# Altium schematic sheet Sensor_FMU.SchDoc
size A4; SheetNumber: 3; SheetTotal: 5
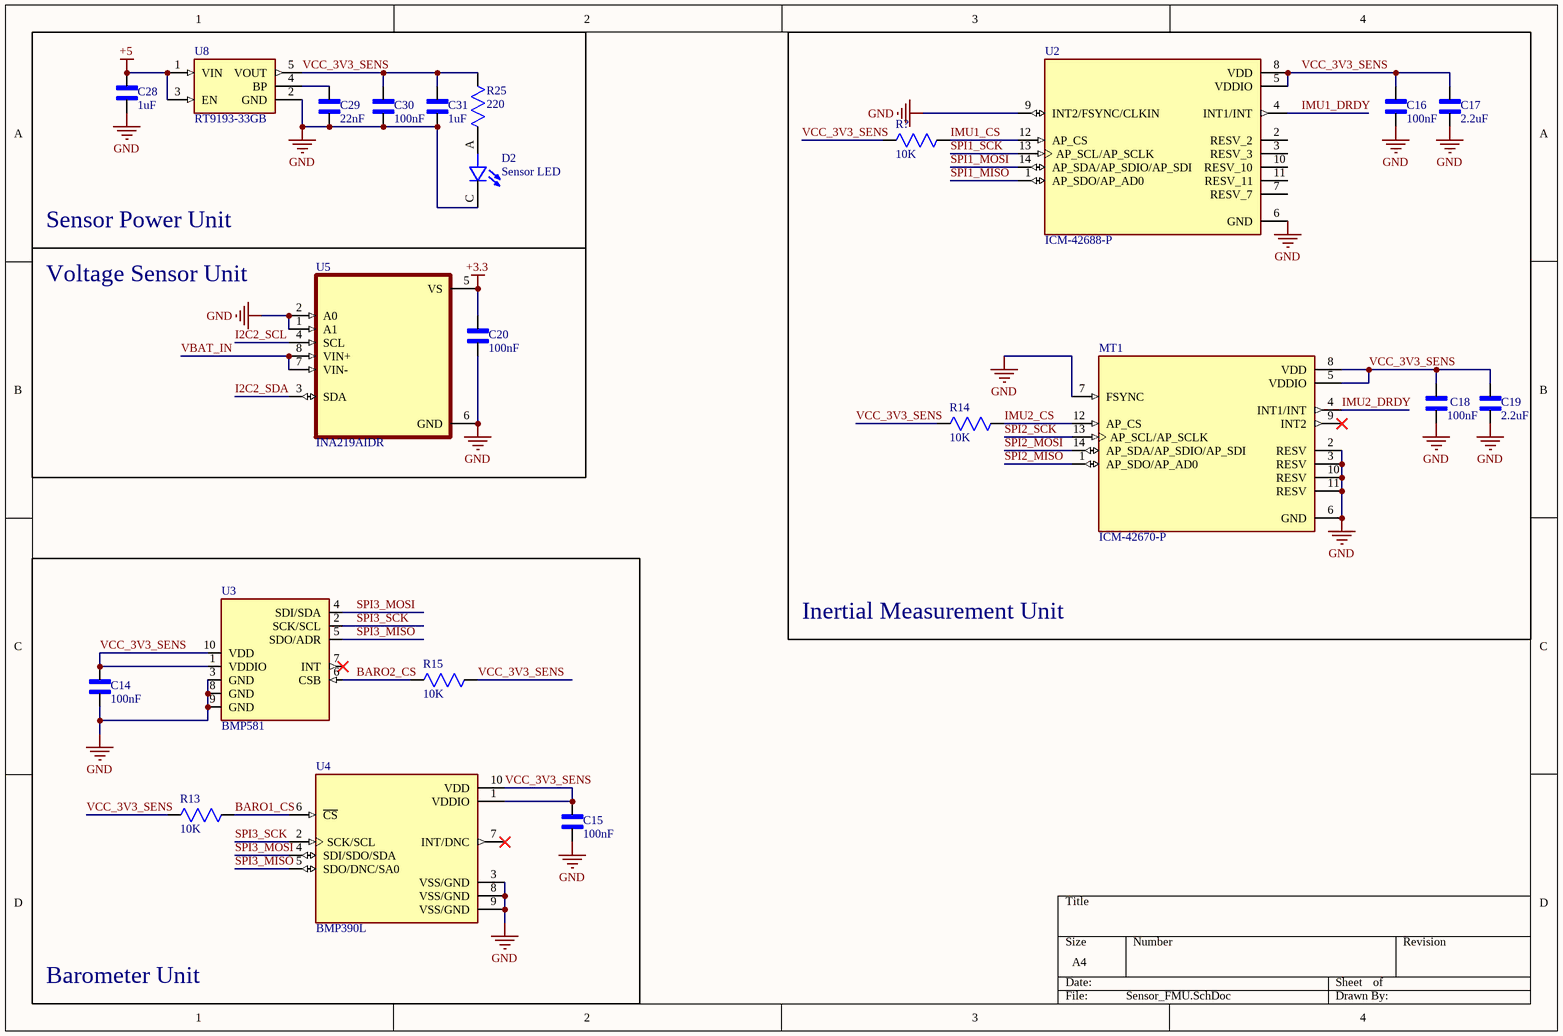
[diagram p0: Sensor_FMU.SchDoc]

## Parts
C14  100nF  [CAPC2012X135N]
C15  100nF  [CAPC2012X135N]
C16  100nF  [CAPC2012X135N]
C17  2.2uF  [CAPC2012X152N]
C18  100nF  [CAPC2012X135N]
C19  2.2uF  [CAPC2012X152N]
C20  100nF  [CAPC1608X90N]
C28  1uF  [CAPC1608X90N]
C29  22nF  [CAPC1608X90N]
C30  100nF  [CAPC1608X90N]
C31  1uF  [CAPC1608X90N]
D2  Sensor LED  [LEDSC125X200X90-2N]
MT1  ICM-42670-P  [XDCR_ICM-42670-P]
R13  10K  [RESC2013X65N]
R14  10K  [RESC2013X65N]
R15  10K  [RESC2013X65N]
R25  220  [RESC2013X65N]
R?  10K  [RESC2013X65N]
U2  ICM-42688-P  [PQFN50P300X250X97-14N]
U3  BMP581  [BMP581]
U4  BMP390L  [XDCR_BMP390L]
U5  INA219AIDR  [SOIC127P599X175-8N]
U8  RT9193-33GB  [SOT94P279X129-5N]

## Blocks framed on the sheet
Sensor Power Unit: C28-C31 D2 R25 U8
Inertial Measurement Unit: C16-C19 MT1 R14 R? U2
Voltage Sensor Unit: C20 U5
Barometer Unit: C14 C15 R13 R15 U3 U4

## Nets
+3.3: C20.2 U5.5(VS)
+5: C28.2 U8.1(VIN) U8.3(EN)
GND: C14.1 C15.1 C16.1 C17.2 C18.1 C19.2 C20.1 C28.1 C29.1 C30.1 C31.1 D2.C MT1.2(RESV) MT1.3(RESV) MT1.6(GND) MT1.7(FSYNC) MT1.10(RESV) MT1.11(RESV) U2.6(GND) U2.9(INT2/FSYNC/CLKIN) U3.3(GND) U3.8(GND) U3.9(GND) U4.3(VSS/GND) U4.8(VSS/GND) U4.9(VSS/GND) U5.1(A1) U5.2(A0) U5.6(GND) U8.2(GND)
BARO1_CS: R13.2(R2) U4.6(~{CS})
BARO2_CS: R15.2(R2) U3.6(CSB)
I2C2_SCL: U5.4(SCL)
I2C2_SDA: U5.3(SDA)
IMU1_CS: R?.2(R2) U2.12(AP_CS)
IMU1_DRDY: U2.4(INT1/INT)
IMU2_CS: MT1.12(AP_CS) R14.2(R2)
IMU2_DRDY: MT1.4(INT1/INT)
SPI1_MISO: U2.1(AP_SDO/AP_AD0)
SPI1_MOSI: U2.14(AP_SDA/AP_SDIO/AP_SDI)
SPI1_SCK: U2.13(AP_SCL/AP_SCLK)
SPI2_MISO: MT1.1(AP_SDO/AP_AD0)
SPI2_MOSI: MT1.14(AP_SDA/AP_SDIO/AP_SDI)
SPI2_SCK: MT1.13(AP_SCL/AP_SCLK)
SPI3_MISO: U3.5(SDO/ADR) U4.5(SDO/DNC/SA0)
SPI3_MOSI: U3.4(SDI/SDA) U4.4(SDI/SDO/SDA)
SPI3_SCK: U3.2(SCK/SCL) U4.2(SCK/SCL)
VBAT_IN: U5.7(VIN-) U5.8(VIN+)
VCC_3V3_SENS: C14.2 C15.2 C16.2 C17.1 C18.2 C19.1 C30.2 C31.2 MT1.5(VDDIO) MT1.8(VDD) R13.1(R1) R14.1(R1) R15.1(R1) R25.1(R1) R?.1(R1) U2.5(VDDIO) U2.8(VDD) U3.1(VDDIO) U3.10(VDD) U4.1(VDDIO) U4.10(VDD) U8.5(VOUT)
NetC29_2: C29.2 U8.4(BP)
NetD2_A: D2.A R25.2(R2)

Not connected (* = marked no-connect by the designer): MT1 9(INT2)*; U2 2(RESV_2) 3(RESV_3) 7(RESV_7) 10(RESV_10) 11(RESV_11); U3 7(INT)*; U4 7(INT/DNC)*

## Library data of the parts
C14-C16 C18 = GRM21BR71H104KA01L: ÐšÐ¾Ð½Ð´ÐµÐ½ÑÐ°Ñ‚Ð¾Ñ€ SMD X7R(EIA) Ñ Ñ‘Ð¼ÐºÐ¾ÑÑ‚ÑŒÑŽ: 0,10 Ð¼ÐºÐ¤ Â± 10%. ÐÐ¾Ð¼Ð¸Ð½Ð°Ð»ÑŒÐ½Ð¾Ðµ Ð½Ð°Ð¿Ñ€ÑÐ¶ÐµÐ½Ð¸Ðµ: 50 Ð’ Ð¿Ð¾ÑÑ‚Ð¾ÑÐ½Ð½Ð¾Ð³Ð¾ Ñ‚Ð¾ÐºÐ°; MF: Murata; SnapEDA_Link: https://www.snapeda.com/parts/GRM21BR71H104KA01L/Murata/view-part/?ref=snap; Package: 805-2 Murata; Value: *; MP: GRM21BR71H104KA01L; Check_prices: https://www.snapeda.com/parts/GRM21BR71H104KA01L/Murata/view-part/?ref=eda
C17 C19 = 08053C225K4Z2A: 2.2 ÂµF Â±10% 25V Ceramic Capacitor X7R 0805 (2012 Metric); MF: AVX; SnapEDA_Link: https://www.snapeda.com/parts/08053C225K4Z2A/AVX/view-part/?ref=snap; Package: 2012 AVX; Value: *; MP: 08053C225K4Z2A; Check_prices: https://www.snapeda.com/parts/08053C225K4Z2A/AVX/view-part/?ref=eda
C20 C28-C31 = GRM188R71H104KA93D: SMD Capacitor X7R(EIA) with Capacitance: 0.10uF Tol. 10%. Rated Voltage: 50Vdc; MF: Murata; SnapEDA_Link: https://www.snapeda.com/parts/GRM188R71H104KA93D/Murata/view-part/?ref=snap; Package: 1608 Murata; Value: *; MP: GRM188R71H104KA93D; Check_prices: https://www.snapeda.com/parts/GRM188R71H104KA93D/Murata/view-part/?ref=eda
D2 = 5990110007F: Red 633nm LED Indication - Discrete 2.1V 0805 (2012 Metric); MF: Dialight; MP: 599-0110-007F; Check_prices: https://www.snapeda.com/parts/599-0110-007F/Dialight/view-part/?ref=eda; Value: *; Purchase-URL: https://pricing.snapeda.com/search/part/599-0110-007F/?ref=eda; Price: None; SnapEDA_Link: https://www.snapeda.com/parts/599-0110-007F/Dialight/view-part/?ref=snap; Availability: In Stock; Package: 0805 Dialight
R13-R15 R25 R? = RC0805FR-075K1L: 5.1 kOhms Â±1% 0.125W, 1/8W Chip Resistor 0805 (2012 Metric) Moisture Resistant Thick Film; MF: Yageo; MP: RC0805FR075K1L; SnapEDA_Link: https://www.snapeda.com/parts/RC0805FR075K1L/Yageo/view-part/?ref=snap; Package: 0805-2 YAGEO; Value: *; Check_prices: https://www.snapeda.com/parts/RC0805FR075K1L/Yageo/view-part/?ref=eda
U2 = ICM-42688-P: Accelerometer, Gyroscope, 6 Axis Sensor Output; Package: None; MP: ICM-42688-P; Value: *; Availability: Unavailable; Price: None
U3 = BMP581: Very small, low-power and low noise 24-bit absolute barometric pressure sensor. This digital, high-performance sensor is ideally suited for a wide range of altitude tracking applications and offers outstanding design flexibility; MF: Bosch; SnapEDA_Link: https://www.snapeda.com/parts/BMP581/Bosch/view-part/?ref=snap; Package: None; Value: *; MP: BMP581; Check_prices: https://www.snapeda.com/parts/BMP581/Bosch/view-part/?ref=eda
U4 = BMP390L: Pressure Sensor 4.35PSI ~ 18.13PSI (30kPa ~ 125kPa) Absolute - - 10-WFLGA; MF: Bosch Sensortec; SnapEDA_Link: https://www.snapeda.com/parts/BMP390L/Bosch+Sensortec/view-part/?ref=snap; Package: None; Value: *; MP: BMP390L; Check_prices: https://www.snapeda.com/parts/BMP390L/Bosch+Sensortec/view-part/?ref=eda
U5 = INA219AIDR: 26-V 12-bit I2C output digital power monitor; MF: Texas Instruments; SnapEDA_Link: https://www.snapeda.com/parts/INA219AIDR/Texas+Instruments/view-part/?ref=snap; Package: SOIC-8 Texas Instruments; Value: *; MP: INA219AIDR; Check_prices: https://www.snapeda.com/parts/INA219AIDR/Texas+Instruments/view-part/?ref=eda
U8 = RT9193-33GB: Linear Voltage Regulator IC Positive Fixed 1 Output 300mA TSOT-23-5; MF: Richtek USA; SnapEDA_Link: https://www.snapeda.com/parts/RT9193-33GB/Richtek+USA+Inc./view-part/?ref=snap; Package: SOT-23-5 Richtek; MP: RT9193-33GB; Check_prices: https://www.snapeda.com/parts/RT9193-33GB/Richtek+USA+Inc./view-part/?ref=eda; Purchase-URL: https://pricing.snapeda.com/search/part/RT9193-33GB/?ref=eda; Digi-Key_Part_Number: 1028-1014-2-ND; Value: *
MT1 = ICM-42670-P: Package: None; Price: None; Value: *; MP: ICM-42670-P; Availability: Unavailable